# Altium project PCB_Project.PrjPcb
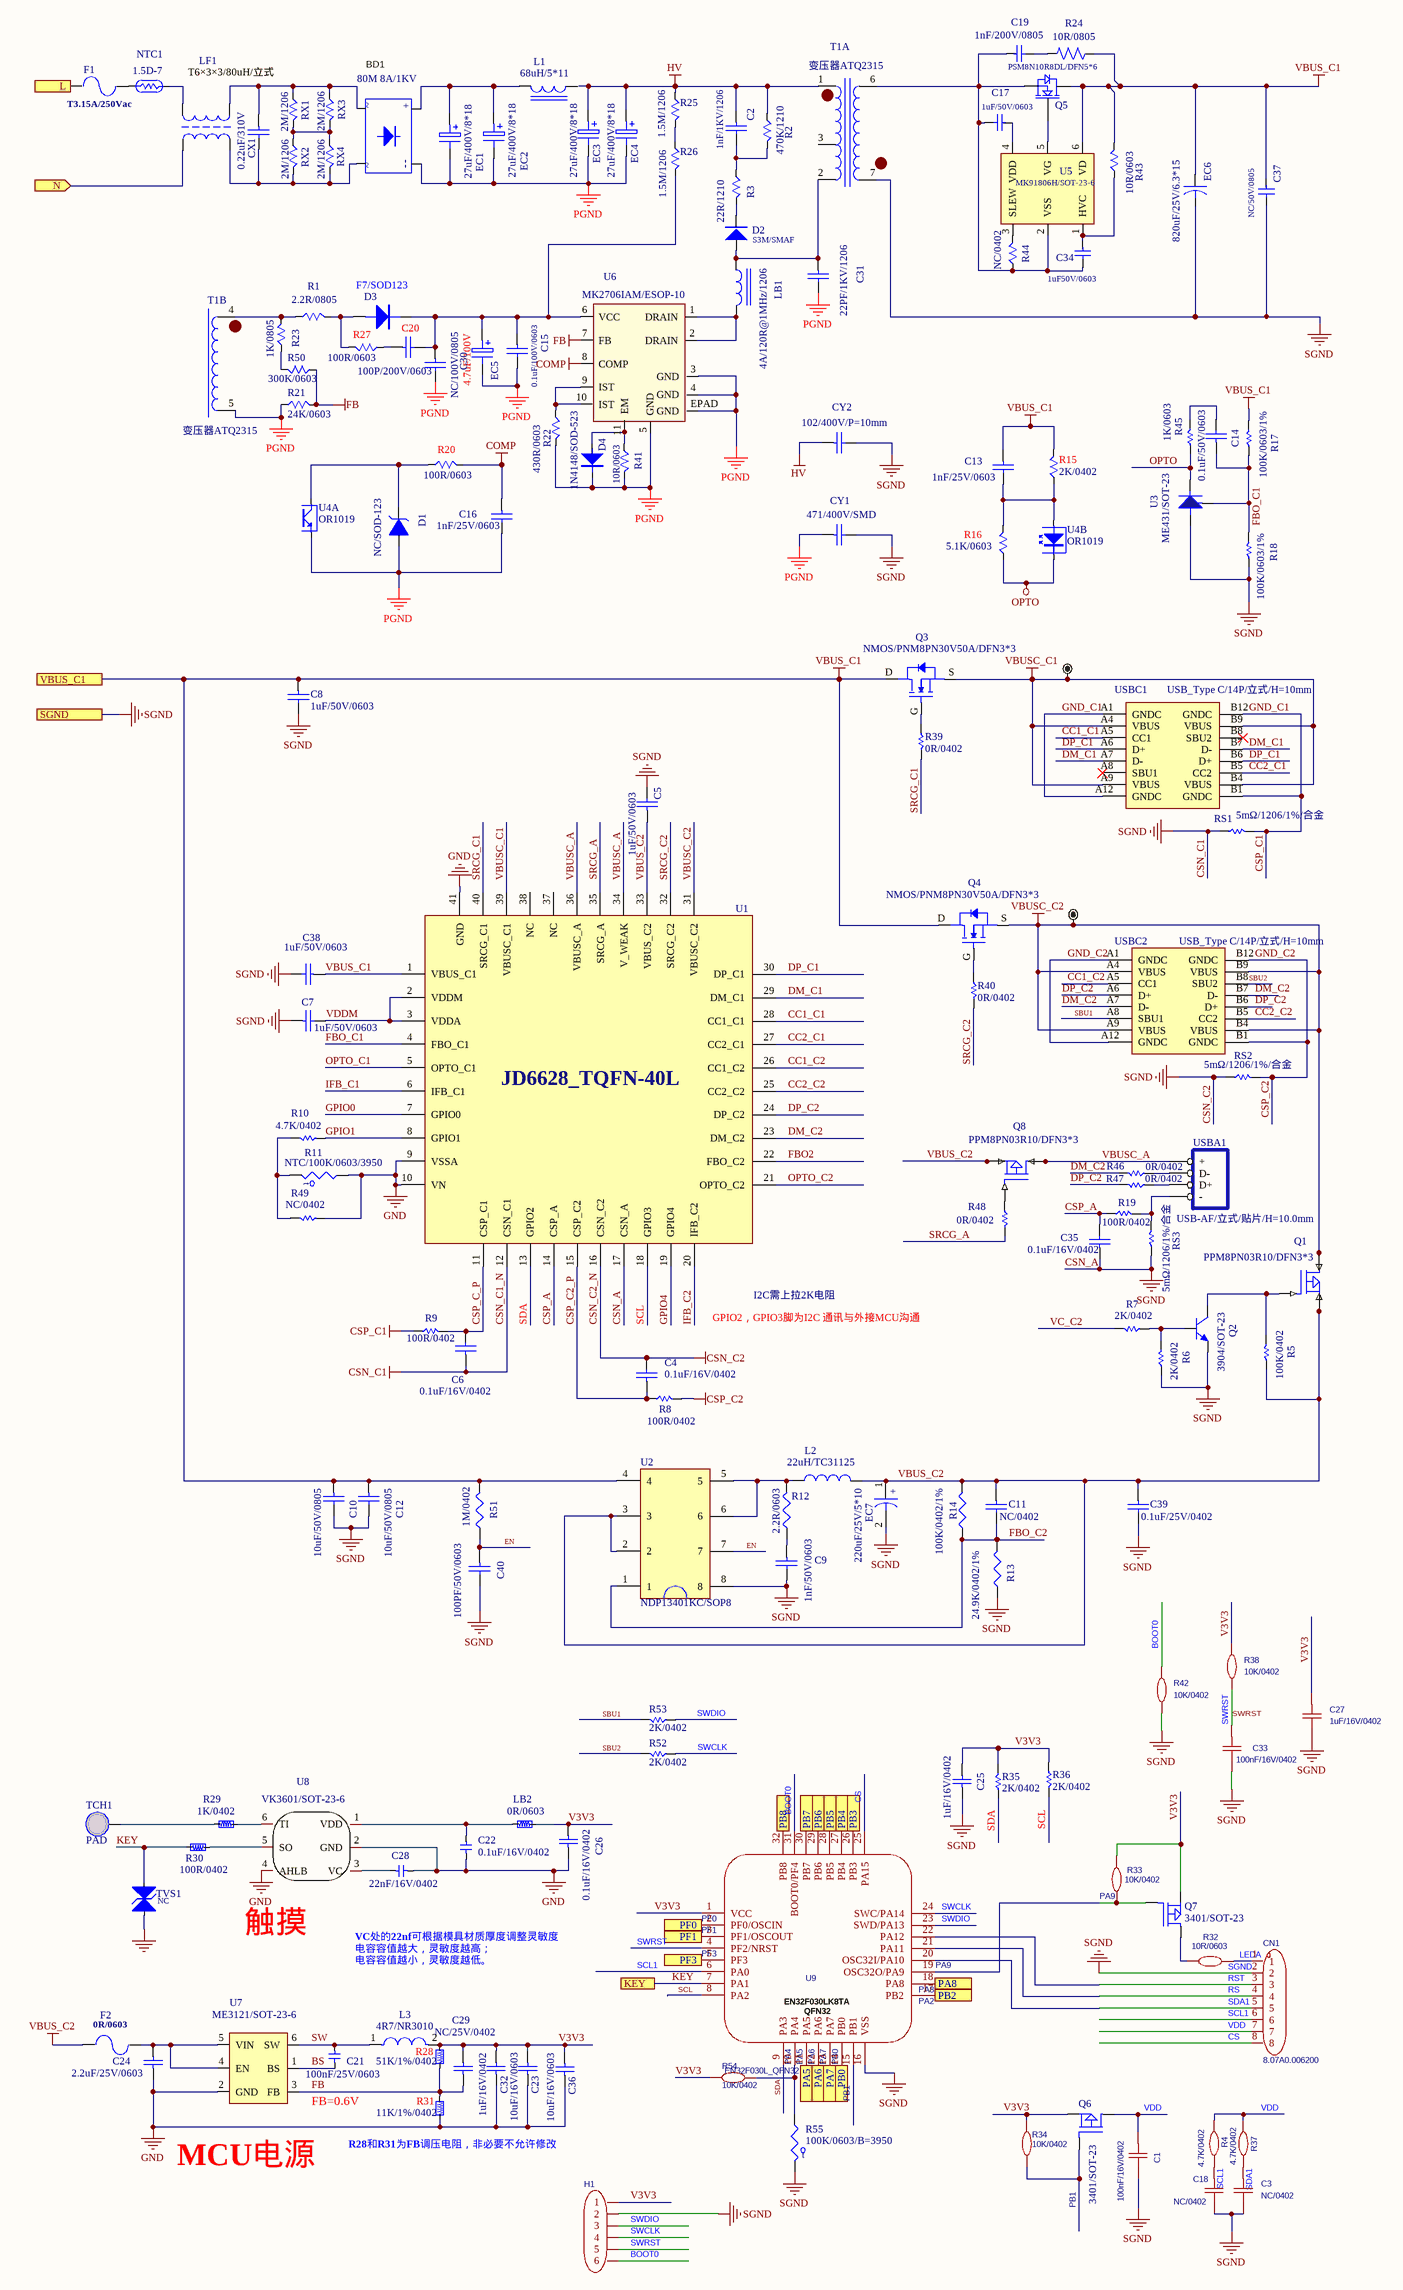
[diagram p0: PD67W MK2706IAM+MK91806H+JD6628 2C1A  跟随.SchDoc]
1 sheet, 153 parts. Net scope: flat (ports and power ports of the same name join across sheets).
Board files: TYH-PD67W 2C1A 主控板.pcbdoc, TYH-PD67W 2C1A 主控板.pcbdoc, TYH-PD67W 2C1A 主板.pcbdoc, TYH-PD67W 2C1A 协议板.pcbdoc, TYH-PD67W 2C1A AC板.pcbdoc

## Sheet PD67W MK2706IAM+MK91806H+JD6628 2C1A  跟随.SchDoc
size 330 x 549 mm

### Parts
BD1  80M 8A/1KV  [BD_ABS-6-2]
C1  100nF/16V/0402  [0402C]
C2  1nF/1KV/1206  [C1206-t]
C3  NC/0402  [0402C]
C4  0.1uF/16V/0402  [C0603]
C5  1uF/50V/0603  [C0805]
C6  0.1uF/16V/0402  [C0603]
C7  1uF/50V/0603  [C0603]
C8  1uF/50V/0603  [C0805]
C9  1nF/50V/0603  [C0603]
C10  10uF/50V/0805  [C0603]
C11  NC/0402  [C0603]
C12  10uF/50V/0805  [C0603]
C13  1nF/25V/0603  [C0603-T]
C14  0.1uF/50V/0603  [C0805]
C15  0.1uF/100V/0603  [C0603-T]
C16  1nF/25V/0603  [C0603-T]
C17  1uF/50V/0603  [C0603-S]
C18  NC/0402  [0402C]
C19  1nF/200V/0805  [C0805]
C20  100P/200V/0603  [C1206-t]
C21  100nF/25V/0603  [0402C]
C22  0.1uF/16V/0402  [0402C]
C23  10uF/16V/0603  [0805C]
C24  2.2uF/25V/0603  [0805C]
C25  1uF/16V/0402  [0805C]
C26  0.1uF/16V/0402  [0805C]
C27  1uF/16V/0402  [0402C]
C28  22nF/16V/0402  [0402C]
C29  NC/25V/0402  [0805C]
C30  NC/100V/0805  [C0603-T]
C31  22PF/1KV/1206  [C1206-t]
C32  1uF/16V/0402  [0805C]
C33  100nF/16V/0402  [0402C]
C34  1uF50V/0603  [C0603-S]
C35  0.1uF/16V/0402  [C0603]
C36  10uF/16V/0603  [0805C]
C37  NC/50V/0805  [C0603-S]
C38  1uF/50V/0603  [C0805]
C39  0.1uF/25V/0402  [C0603]
C40  100PF/50V/0603  [C0603]
CN1  8.07A0.006200  [DIP8]
CX1  0.22uF/310V  [CX6*12]
CY1  471/400V/SMD  [C1206-t]
CY2  102/400V/P=10mm  [C1206-t]
D1  NC/SOD-123  [SOD-523-T]
D2  S3M/SMAF  [D(SMA)-t]
D3  F7/SOD123  [D-SOD123]
D4  1N4148/SOD-523  [DO-201]
EC1  27uF/400V/8*18  [CEV10]
EC2  27uF/400V/8*18  [CEV10]
EC3  27uF/400V/8*18  [CEV8]
EC4  27uF/400V/8*18  [CEV8]
EC5  4.7uF/100V  [CEV5]
EC6  820uF/25V/6.3*15  [CE6.3X15]
EC7  220uF/25V/5*10  [CE-D8-P3.5]
F1  T3.15A/250Vac  [FUSE4X8]
F2  0R/0603  [FUSE4X8]
H1  (no value)  [SO-8S]
L1  68uH/5*11  [L-6.5MAX-P2.5]
L2  22uH/TC31125  [IND\AMPI0630\5.9MM(DIP+SMD)]
L3  4R7/NR3010  [L4*4]
LB1  4A/120R@1MHz/1206  [L-6.5MAX-P2.5]
LB2  0R/0603  [0402R]
LF1  T6×3×3/80uH/立式  [L12.7×7.9×4]
NTC1  1.5D-7  [5D-5]
Q1  PPM8PN03R10/DFN3*3
Q2  3904/SOT-23  [SOT-23]
Q3  NMOS/PNM8PN30V50A/DFN3*3  [MOS\DFN-8(3x3)]
Q4  NMOS/PNM8PN30V50A/DFN3*3  [MOS\DFN-8(3x3)]
Q5  PSM8N10R8DL/DFN5*6
Q6  3401/SOT-23  [SOT-23]
Q7  3401/SOT-23  [SOT-23]
Q8  PPM8PN03R10/DFN3*3
R1  2.2R/0805  [R0603-T]
R2  470K/1210  [R1206-T]
R3  22R/1210  [R1206-T]
R4  4.7K/0402  [0402R]
R5  100K/0402  [R0603]
R6  2K/0402  [R0603]
R7  2K/0402  [R0603]
R8  100R/0402  [R0603]
R9  100R/0402  [R0603]
R10  4.7K/0402  [R0603]
R11  NTC/100K/0603/3950  [SIP2-2.5]
R12  2.2R/0603  [R0603]
R13  24.9K/0402/1%  [R0603]
R14  100K/0402/1%  [R0603]
R15  2K/0402  [R0603-T]
R16  5.1K/0603  [R0603-T]
R17  100K/0603/1%  [R0603]
R18  100K/0603/1%  [R0603]
R19  100R/0402  [R0603]
R20  100R/0603  [R0603-T]
R21  24K/0603  [R0603-T]
R22  430R/0603  [R0603-T]
R23  1K/0805  [R0603-T]
R24  10R/0805  [R1206-T]
R25  1.5M/1206  [R0603-T]
R26  1.5M/1206  [R0603-T]
R27  100R/0603  [R0603-T]
R28  51K/1%/0402  [0402R]
R29  1K/0402  [0402R]
R30  100R/0402  [0402R]
R31  11K/1%/0402  [0402R]
R32  10R/0603  [0603RX]
R33  10K/0402  [0402R]
R34  10K/0402  [0402R]
R35  2K/0402  [R0603]
R36  2K/0402  [R0603]
R37  4.7K/0402  [0402R]
R38  10K/0402  [0402R]
R39  0R/0402  [R0603]
R40  0R/0402  [R0603]
R41  10R/0603  [R0603-T]
R42  10K/0402  [0402R]
R43  10R/0603  [R1206-T]
R44  NC/0402  [R1206-T]
R45  1K/0603  [R0603]
R46  0R/0402  [R0603]
R47  0R/0402  [R0603]
R48  0R/0402  [R0603]
R49  NC/0402  [R0603]
R50  300K/0603  [R0603-T]
R51  1M/0402  [R0603]
R52  2K/0402  [R0603]
R53  2K/0402  [R0603]
R54  10K/0402  [0402R]
R55  100K/0603/B=3950  [SIP2-2.5]
RS1  5mΩ/1206/1%/合金  [1206]
RS2  5mΩ/1206/1%/合金  [1206]
RS3  5mΩ/1206/1%/合金  [1206]
RX1  2M/1206  [R1206-T]
RX2  2M/1206  [R1206-T]
RX3  2M/1206  [R1206-T]
RX4  2M/1206  [R1206-T]
T1  变压器ATQ2315  [ATQ17-13]  (parts A,B of 2)
TCH1  PAD  [1PIN]
TVS1  NC  [DFN1006-2L]
U1  JD6628_TQFN-40L  [IC\QFN-40\0.4mm\5x5mm]
U2  NDP13401KC/SOP8  [DIP8]
U3  ME431/SOT-23  [SOT-23]
U4  OR1019  [CT1018]  (parts A,B of 2)
U5  MK91806H/SOT-23-6
U6  MK2706IAM/ESOP-10  [SO-10]
U7  ME3121/SOT-23-6  [SOT-23-6]
U8  VK3601/SOT-23-6  [SOT-23-6]
U9  EN32F030L_QFN32  [QFN32 4*4]
USBA1  USB-AF/立式/贴片/H=10.0mm  [USB 10.0H]
USBC1  USB_Type C/14P/立式/H=10mm  [USB_SBC-160S1-20-S235]
USBC2  USB_Type C/14P/立式/H=10mm  [USB_SBC-160S1-20-S235]
VBUSC_C1  TP\H50MIL  [TP\H50MIL]  (value not drawn)
VBUSC_C2  TP\H50MIL  [TP\H50MIL]  (value not drawn)

### Ports
KEY, L (in), N (in), PA5 (in), PA6 (in), PA7 (in), PA8 (in), PB0 (in), PB2 (in), PB3 (in), PB4 (in), PB5 (in), PB6 (in), PB7 (in), PB8 (in), PF0 (in), PF1 (in), PF3 (in), SGND, VBUS_C1

### Nets
COMP: C16.1 R20.2 U6.8(COMP)
CSN_A: C1.1 C3.1 C4.2 C5.2 C6.1 C7.1 C8.2 C9.2 C10.2 C12.2 C18.1 C25.1 C27.1 C33.1 C35.1 C37.2 C38.2 C39.2 C40.2 CN1.2 CY1.2 CY2.2 EC6.2 EC7.2 H1.2 Q2.2(E) R6.1 R13.1 R18.1 R42.1 R55.2 RS1.1 RS2.1 RS3.1 T1.7 U1.12(CSN_C1) U1.16(CSN_C2) U1.17(CSN_A) U2.8 U3.3 U9.16(VSS) ; port SGND  [also labelled CSN_C1, CSN_C1_N, CSN_C2, CSN_C2_N, SGND]
CSP_C1: R9.1 RS1.2 USBC1.A1(GNDC) USBC1.A12(GNDC) USBC1.B1(GNDC) USBC1.B12(GNDC)  [also labelled GND_C1]
CSP_C2: R8.2 RS2.2 USBC2.A1(GNDC) USBC2.A12(GNDC) USBC2.B1(GNDC) USBC2.B12(GNDC)  [also labelled GND_C2]
FB: C29.1 R21.2 R28.1 R31.2 R50.1 U6.7(FB) U7.3(FB)
GND: C22.2 C23.1 C24.1 C26.1 C28.1 C32.1 C36.1 R11.1 R31.1 R49.1 TVS1.1(A) U1.9(VSSA) U1.10(VN) U1.41(GND) U7.2(GND) U8.2(GND) U8.4(AHLB)
HV: C2.1 CY2.1 EC3.1 EC4.1 R2.1 R25.1 T1.1
OPTO: R16.1 R45.1 U3.2 U4.2(K)
PGND: BD1.2 C15.2 C16.2 C30.2 C31.2 CY1.1 D1.1(A) D4.2(K) EC1.2 EC2.2 EC3.2 EC4.2 EC5.2 R21.1 R22.2 R41.2 T1.5 U4.3(E) U6.3(GND) U6.4(GND) U6.5(GND) U6.EPAD(GND)
VBUS_C1: C8.1 C10.1 C12.1 C13.1 C37.1 C38.1 EC6.1 Q3.D Q4.D Q5.?2 R15.2 R17.2 R24.1 R43.2 R51.2 U1.1(VBUS_C1) U2.4 U5.6(VD) ; port VBUS_C1
VBUS_C2: C5.1 C11.1 C39.1 EC7.1 F2.2 L2.2 Q1.1 Q1.2 Q1.3 Q8.1 Q8.2 Q8.3 R5.1 R14.2 U1.33(VBUS_C2) U2.2 U2.3
VBUSC_C1: Q3.S U1.39(VBUSC_C1) USBC1.A4(VBUS) USBC1.A9(VBUS) USBC1.B4(VBUS) USBC1.B9(VBUS) VBUSC_C1.1
VBUSC_C2: Q1.5 Q1.6 Q1.7 Q1.8 Q4.S U1.31(VBUSC_C2) USBC2.A4(VBUS) USBC2.A9(VBUS) USBC2.B4(VBUS) USBC2.B9(VBUS) VBUSC_C2.1
BOOT0: H1.6 R42.2 U9.31(BOOT0/PF4)
BS: C21.1 U7.1(BS)
CC1_C1: U1.28(CC1_C1) USBC1.A5(CC1)
CC1_C2: U1.26(CC1_C2) USBC2.A5(CC1)
CC2_C1: U1.27(CC2_C1) USBC1.B5(CC2)
CC2_C2: U1.25(CC2_C2) USBC2.B5(CC2)
CS: CN1.8 U9.25(PA15)
CSP_A: C35.2 R19.1 U1.14(CSP_A)
CSP_C2_P: C4.1 R8.1 U1.15(CSP_C2)
CSP_C_P: C6.2 R9.2 U1.11(CSP_C1)
DM_C1: U1.29(DM_C1) USBC1.A7(D-) USBC1.B7(D-)
DM_C2: R46.2 U1.23(DM_C2) USBC2.A7(D-) USBC2.B7(D-)
DP_C1: U1.30(DP_C1) USBC1.A6(D+) USBC1.B6(D+)
DP_C2: R47.2 U1.24(DP_C2) USBC2.A6(D+) USBC2.B6(D+)
EN: C40.1 R51.1 U2.7
FBO2: U1.22(FBO_C2)
FBO_C1: C14.1 R17.1 R18.2 U1.4(FBO_C1) U3.1(R)
FBO_C2: C11.2 R13.2 R14.1 U2.1
GPIO0: U1.7(GPIO0)
GPIO1: R10.1 U1.8(GPIO1)
GPIO4: U1.19(GPIO4)
IFB_C1: U1.6(IFB_C1)
IFB_C2: U1.20(IFB_C2)
KEY: R30.2 TVS1.2(A) U9.7(PA1) ; port KEY
LEDA: CN1.1 R32.2
OPTO_C1: U1.5(OPTO_C1)
OPTO_C2: U1.21(OPTO_C2)
PA2: U9.17(PB2) ; port PB2
PA4: R54.2 R55.1 U9.10(PA4)
PA5: U9.11(PA5) ; port PA5
PA6: U9.12(PA6) ; port PA6
PA7: U9.13(PA7) ; port PA7
PA8: U9.18(PA8) ; port PA8
PA9: Q7.1(G) R33.2 U9.19(OSC32O/PA9)
PB0: U9.14(PB0) ; port PB0
PB1: Q6.1(G) R34.2 U9.15(PB1)
PF0: U9.2(PF0/OSCIN) ; port PF0
PF1: U9.3(PF1/OSCOUT) ; port PF1
PF3: U9.5(PF3) ; port PF3
RS: CN1.4 U9.21(PA11)
RST: CN1.3 U9.22(PA12)
SBU1: R53.2 USBC2.A8(SBU1)
SBU2: R52.2 USBC2.B8(SBU2)
SCL: R36.2 U1.18(GPIO3) U9.8(PA2)
SCL1: C18.2 CN1.6 R4.2 U9.6(PA0)
SDA: R35.1 U1.13(GPIO2) U9.9(PA3)
SDA1: C3.2 CN1.5 R37.2 U9.20(OSC32I/PA10)
SRCG_A: R48.2 U1.35(SRCG_A)
SRCG_C1: R39.2 U1.40(SRCG_C1)
SRCG_C2: R40.2 U1.32(SRCG_C2)
SW: C21.2 L3.1 U7.6(SW)
SWCLK: H1.4 R52.1 U9.24(SWC/PA14)
SWDIO: H1.3 R53.1 U9.23(SWD/PA13)
SWRST: C33.2 H1.5 R38.1 U9.4(PF2/NRST)
V3V3: C23.2 C25.2 C26.2 C27.2 C29.2 C32.2 C36.2 H1.1 L3.2 LB2.2 Q6.2(S) Q7.2(S) R28.2 R33.1 R34.1 R35.2 R36.1 R38.2 R54.1 U9.1(VCC)
VBUSC_A: Q8.5 Q8.6 Q8.7 Q8.8 U1.34(V_WEAK) U1.36(VBUSC_A) USBA1.+
VC_C2: R7.2
VDD: C1.2 CN1.7 Q6.3(D) R4.1 R37.1
VDDM: C7.2 U1.2(VDDM) U1.3(VDDA)
NetBD1_1: BD1.1 EC1.1 EC2.1 L1.2
NetBD1_3: BD1.3 CX1.2 LF1.4 RX2.2 RX4.2
NetBD1_4: BD1.4 CX1.1 LF1.1 RX1.1 RX3.1
NetC2_2: C2.2 R2.2 R3.1
NetC9_1: C9.1 R12.1
NetC13_2: C13.2 R15.1 R16.2 U4.1(A)
NetC14_2: C14.2 R45.2
NetC15_1: C15.1 C20.2 C30.1 D3.2 EC5.1 R26.2 U6.6(VCC)
NetC17_1: C17.1 U5.4(VDD)
NetC17_2: C17.2 C19.1 C34.2 Q5.?3 R44.1 T1.6 U5.2(VSS)
NetC19_2: C19.2 R24.2
NetC20_1: C20.1 R27.1
NetC22_1: C22.1 LB2.1 U8.1(VDD)
NetC24_2: C24.2 F2.1 U7.4(EN) U7.5(VIN)
NetC28_2: C28.2 U8.3(VC)
NetC31_1: C31.1 D2.A LB1.1 T1.2
NetC34_1: C34.1 R43.1 U5.1(HVC)
NetD1_2: D1.2(K) R20.1 U4.4(C)
NetD2_K: D2.K R3.2
NetD3_1: D3.1 R1.2 R27.2
NetD4_1: D4.1(A) R41.1 U6.11(EM)
NetF1_1: F1.1 NTC1.1
NetF1_2: F1.2 ; port L
NetL2_1: L2.1 R12.2 U2.5 U2.6
NetLB1_2: LB1.2 U6.1(DRAIN) U6.2(DRAIN)
NetLF1_2: LF1.2 NTC1.2
NetLF1_3: LF1.3 ; port N
NetQ1_4: Q1.4 Q2.3(C) R5.2
NetQ2_1: Q2.1(B) R6.2 R7.1
NetQ3_G: Q3.G R39.1
NetQ4_G: Q4.G R40.1
NetQ5_?1: Q5.?1 U5.5(VG)
NetQ7_3: Q7.3(D) R32.1
NetQ8_4: Q8.4 R48.1
NetR1_1: R1.1 R23.2 T1.4
NetR10_2: R10.2 R11.2 R49.2
NetR19_2: R19.2 RS3.2 USBA1.-
NetR22_1: R22.1 U6.9(IST) U6.10(IST)
NetR23_1: R23.1 R50.2
NetR25_2: R25.2 R26.1
NetR29_1: R29.1 TCH1.1
NetR29_2: R29.2 U8.6(TI)
NetR30_1: R30.1 U8.5(SO)
NetR44_2: R44.2 U5.3(SLEW)
NetR46_1: R46.1 USBA1.D-
NetR47_1: R47.1 USBA1.D+
NetRX1_2: RX1.2 RX2.1 RX3.2 RX4.1
NetU9_26: U9.26(PB3) ; port PB3
NetU9_27: U9.27(PB4) ; port PB4
NetU9_28: U9.28(PB5) ; port PB5
NetU9_29: U9.29(PB6) ; port PB6
NetU9_30: U9.30(PB7) ; port PB7
NetU9_32: U9.32(PB8) ; port PB8

Not connected (* = marked no-connect by the designer): L1 1; T1 3; U1 37(NC) 38(NC); USBC1 A8(SBU1)* B8(SBU2)*

### Notes on the sheet
- I2C需上拉2K电阻
- GPIO2，GPIO3脚为I2C 通讯与外接MCU沟通
- (near U8) 触摸
- VC处的22nf可根据模具材质厚度调整灵敏度
- 电容容值越大，灵敏度越高；
- 电容容值越小，灵敏度越低。
- FB=0.6V
- MCU电源
- (near R31) R28和R31为FB调压电阻，非必要不允许修改
- (in symbol BD2) ~; +; -
- (in symbol CAP POL) +
- (in symbol EN32F030L_QFN32) EN32F030LK8TA / QFN32
- (in symbol THERMISTOR) t

### Library data of the parts
BD1 = BD2
C1 C3 C18 = CAP_0603: Symbol: Capacitance; Value: 10nF; 3D Model: ac125912035d415993ca9572d50418b1聨0819f05c4eef4c71ace90d822a990e87|; 3D Model Transform: 62.992,31.496,0,0,0,0,0,0,0; ConvertToPcb: yes; ModelName: C0603_L1.6-W0.8-H0.8; Device: CAP_0603; Supplier Footprint: 0603; AddInBom: yes; FootprintName: C0603
C2 C20 C31 CY1 CY2 = C1206
C4-C8 C14 C35 C38 = CAP
C9-C12 C39 C40 = CAP: Capacitor no polarity
C13 C15 C16 C30 = C0603
C17 C19 C34 C37 = CAPACITOR
C21 C22 C28 = CAP: X7R, 25V, +/-5%
C23 C36 = CAP0603: Capacitor; Value: 0603; Published: 8-Jun-2000; LatestRevisionDate: 17-Jul-2002; LatestRevisionNote: Re-released for DXP Platform.; PackageReference: RAD-0.3; Publisher: Altium Limited; PackageDescription: Radial Cap, Thru-Hole; 2 Leads; 0.3 in Pin Spacing
C24 C29 = CAP0603: Capacitor; Value: 0805; Published: 8-Jun-2000; LatestRevisionDate: 17-Jul-2002; LatestRevisionNote: Re-released for DXP Platform.; PackageReference: RAD-0.3; Publisher: Altium Limited; PackageDescription: Radial Cap, Thru-Hole; 2 Leads; 0.3 in Pin Spacing
C25 C26 C32 = CAP0603: Capacitor; Value: 0402; Published: 8-Jun-2000; LatestRevisionDate: 17-Jul-2002; LatestRevisionNote: Re-released for DXP Platform.; PackageReference: RAD-0.3; Publisher: Altium Limited; PackageDescription: Radial Cap, Thru-Hole; 2 Leads; 0.3 in Pin Spacing
C27 = CAP_0603: Symbol: Capacitance; Value: 1uF; 3D Model: ac125912035d415993ca9572d50418b1聨0819f05c4eef4c71ace90d822a990e87|; 3D Model Transform: 62.992,31.496,0,0,0,0,0,0,0; ConvertToPcb: yes; ModelName: C0603_L1.6-W0.8-H0.8; Device: CAP_0603; Supplier Footprint: 0603; AddInBom: yes; FootprintName: C0603
C33 = CAP_0603: Symbol: Capacitance; Value: 100nF; 3D Model: ac125912035d415993ca9572d50418b1聨0819f05c4eef4c71ace90d822a990e87|; 3D Model Transform: 62.992,31.496,0,0,0,0,0,0,0; ConvertToPcb: yes; ModelName: C0603_L1.6-W0.8-H0.8; Device: CAP_0603; Supplier Footprint: 0603; AddInBom: yes; FootprintName: C0603
CN1 = 8.07A0.006200: AddInBom: yes; ModelId: c65f7b8c237e46d0ab01f9c6002df34e聨0819f05c4eef4c71ace90d822a990e87|; ModelName: FPC-SMD_6P-P0.50_8.07A0.006200; ModelTransform: 196.85,150.89954,0,0,0,0,0,10.039,0; Symbol: 8.07A0.006200; Device: 8.07A0.006200; LCSC Part Name: 8.07A0.006200; SupplierPart: C9900007336; ManufacturerPart: 8.07A0.006200; Supplier Footprint: FPC-8.07A0-0.5mm-6pin; JLCPCB Part Class: Extended Part; Supplier: LCSC; ConvertToPcb: yes; FootprintName: FPC-SMD_6P-P0.50_8.07A0.006200
CX1 = CX6*12
D1 = D Zener
D2 = D(SMA)
D3 = D-SOD123: DIODE; Text Field1: D:\DESIGN\LIB\SCHLIB\; BILLION Number: *; Vender: *; Vender Number: *; Price US: *; Price NT: *; Second Source 1: *; Second Source 2: *; Second Source 3: *; Second Source 4: *; BOM Lable: *
D4 = DIODE
EC1 EC2 = CEV10: Text Field1: F:\RD\LIB\SCHLIB\; BILLION Number: *; Vender: *; Vender Number: *; Price US: *; Price NT: *; Second Source 1: *; Second Source 2: *; Second Source 3: *; Second Source 4: *; BOM Lable: *
EC3 EC4 = CEV8: Text Field1: F:\RD\LIB\SCHLIB\; BILLION Number: *; Vender: *; Vender Number: *; Price US: *; Price NT: *; Second Source 1: *; Second Source 2: *; Second Source 3: *; Second Source 4: *; BOM Lable: *
EC5 = CEV5: Text Field1: F:\RD\LIB\SCHLIB\; BILLION Number: *; Vender: *; Vender Number: *; Price US: *; Price NT: *; Second Source 1: *; Second Source 2: *; Second Source 3: *; Second Source 4: *; BOM Lable: *
EC6 = E-CAP: Value: 820uF/25V/6.3*15
EC7 = CAP POL: Capacitor , have polarity
F1 F2 = FUSE
H1 = HDR-M_2.54_1x6P: Symbol: Header-Male-2.54_1x6; 3D Model: 60739dffc9b04830a286435b0fefbd4a聨0819f05c4eef4c71ace90d822a990e87|; 3D Model Transform: 599.999,100,0,0,0,0,0,0,-118.11; ConvertToPcb: yes; ModelName: HDR2.54-M-LI-1X6P; Device: HDR-M_2.54_1x6P; Supplier Part: C37208; AddInBom: yes; FootprintName: HDR-TH_6P-P2.54-V-M-1
L1 LB1 = Inductor Iron
L2 = INDUCTOR
L3 = L
LB2 R28-R31 = RES: 1/8W 5%
LF1 = L12.7×7.9×4
NTC1 = NTC
Q1 Q8 = MOS-P 8PS
Q2 = NPN: NPN Transistor
Q3 Q4 = MOS\NMOS\FKS4004: SOP-8
Q5 = N MOS: 4.2mR/100V
Q6 Q7 = MOSFET P
R1 R15 R16 R20-R23 R25-R27 R41 R50 = R0603
R2 R3 R43 R44 RX1-RX4 = R1206
R4 R32-R34 R37 R38 R42 R54 = Res_0603: 3D Model: fc143cca1e79419f9cd78b61e9279f08聨0819f05c4eef4c71ace90d822a990e87|; 3D Model Transform: 31.8897,63.7794,0,90,0,0,0,0,0; Value: 10K; ConvertToPcb: yes; ModelName: R0603; Device: Res_0603; Supplier Footprint: 0603; AddInBom: yes; FootprintName: R0603
R5-R10 R17-R19 R35 R36 R39 R40 R45-R49 R52 R53 RS1-RS3 = RES SMD
R11 R55 = THERMISTOR
R12-R14 R51 = RES
R24 = RESISTOR
T1 = 变压器
TVS1 = DD ZENER
U1 = JD6628_TQFN-40L: TQFN-40L
U2 = DIP8
U3 = 431
U4 = OPTOISO1: Optoisolator
U5 = MP6908
U6 = U-JW1515H
U7 = ME3116
U8 = RH6016C_1: Symbol: 8205-SOT23-6_1; PCB Footprint: ROMOSS_SOT23-6; Add into BOM: yes; Origin Footprint 1: SOT23-6; Device: RH6016C_1; Origin Footprint 2: ROMOSS_SOT23-6; Convert to PCB: yes; Design Item ID: 8205-SOT23-6_1; Library Name: *; Comment_1: RH6016C
U9 = EN32F030L_QFN32: 3D Model: 44e82d2ccee74d7b8bf79e386322e8e3聨0819f05c4eef4c71ace90d822a990e87|; 3D Model Transform: 197.63739924907682,197.63739924907682,33.858198949880894,0,0,0,0,0,0; AddInBom: yes; ModelName: QFN-32_L5.0-W5.0-P0.50-TL-EP2.3; Symbol: EN32F030L_QFN32; Device: EN32F030L_QFN32; FootprintName: VFQFN-32_L5.0-W5.0-P0.50-TL-EP3.2_8T49N004A-035NLGI; ConvertToPcb: yes
USBA1 = 4 HEADER: 4 Pin Header
USBC1 USBC2 = USB_Type C_FEMALE_16PIN